# Altium schematic sheet HMS.Power.SchDoc
size A4
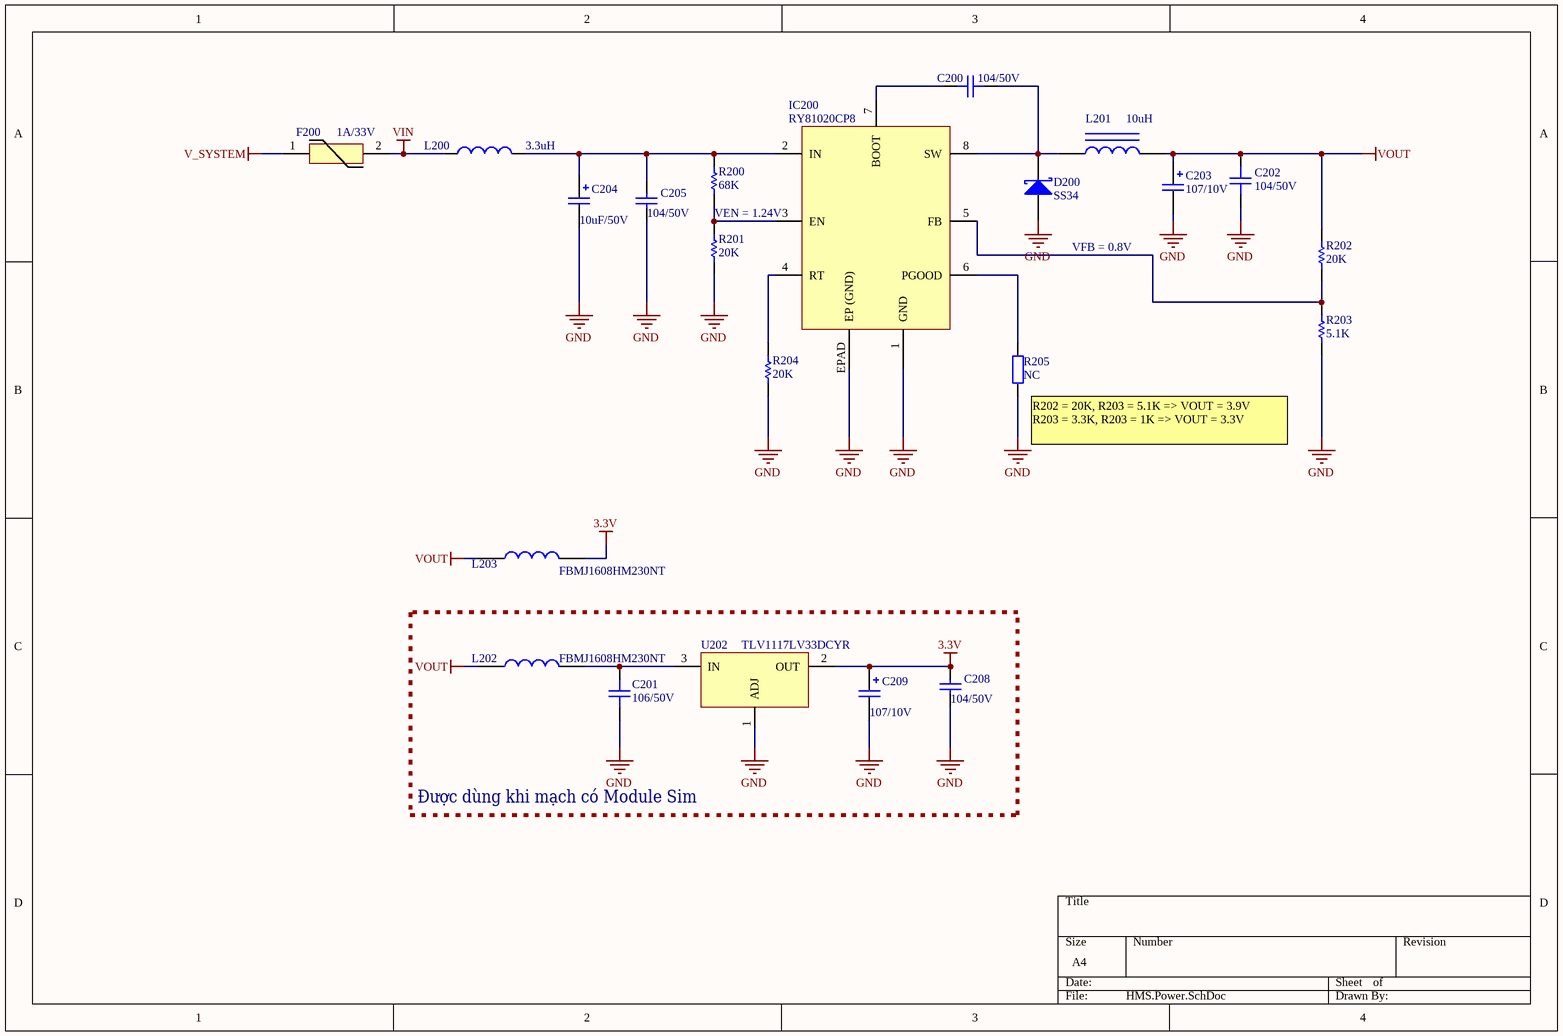
[diagram p0: HMS.Power.SchDoc]

## Parts
C200  104/50V  [CAP_CERAMIC_0402(1005)]
C201  106/50V  [CAP_CERAMIC_1206(3216-18)]
C202  104/50V  [CAP_CERAMIC_0402(1005)]
C203  107/10V  [CAP_TANTAL_2312(6032-28)]
C204  10uF/50V  [CAP_ALUM_SMD_5054_TYPE_C]
C205  104/50V  [CAP_CERAMIC_0402(1005)]
C208  104/50V  [CAP_CERAMIC_0402(1005)]
C209  107/10V  [CAP_TANTAL_2312(6032-28)]
D200  SS34  [DO214AC_SMA_1808]
F200  1A/33V  [MF-MSMF]
IC200  RY81020CP8  [MK9019]
L200  3.3uH  [L2.1A_3.5_3.3]
L201  10uH  [L3A_7x7x3mm]
L202  FBMJ1608HM230NT  [Inductor_0603]
L203  FBMJ1608HM230NT  [Inductor_0603]
R200  68K  [RES_0402(1005)]
R201  20K  [RES_0402(1005)]
R202  20K  [RES_0402(1005)]
R203  5.1K  [RES_0402(1005)]
R204  20K  [RES_0402(1005)]
R205  NC  [RES_0402(1005)]
U202  TLV1117LV33DCYR  [LM1117-SOP]

## Blocks framed on the sheet
Được dùng khi mạch có Module Sim: C201 C208 C209 L202 U202

## Nets
3.3V: C208.2 C209.1 L203.2 U202.2(OUT)
GND: C201.1 C202.1 C203.2 C204.2 C205.1 C208.1 C209.2 D200.1(A) IC200.1(GND) IC200.EPAD(EP_(GND)) R201.1 R203.1 R204.1 R205.1 U202.1(ADJ)
V_SYSTEM: F200.1
VIN: F200.2 L200.1
VOUT: C202.2 C203.1 L201.2 L202.1 L203.1 R202.2
NetC200_1: C200.1 D200.2(K) IC200.8(SW) L201.1
NetC200_2: C200.2 IC200.7(BOOT)
NetC201_2: C201.2 L202.2 U202.3(IN)
NetC204_1: C204.1 C205.2 IC200.2(IN) L200.2 R200.2
NetIC200_3: IC200.3(EN) R200.1 R201.2
NetIC200_4: IC200.4(RT) R204.2
NetIC200_5: IC200.5(FB) R202.1 R203.2
NetIC200_6: IC200.6(PGOOD) R205.2

## Notes on the sheet
- VEN = 1.24V
- VFB = 0.8V
- (near R205) R202 = 20K, R203 = 5.1K => VOUT = 3.9V
  R203 = 3.3K, R203 = 1K => VOUT = 3.3V

## Library data of the parts
C200 C202 = Cap Cer 0603 (1608): CAP CER 0.1UF 50V X5R 0402; MPN: CC0402KRX5R9BB104; MFR: YAGEO; Published: 8-Jun-2000; LatestRevisionDate: 17-Jul-2002; LatestRevisionNote: Re-released for DXP Platform.; PackageReference: RAD-0.3; Publisher: Altium Limited; Value: 104/50V; Category: Ceramic Capacitors
C201 = CL31A106KOHNNNE: CAP Ceramic 106/50V 10% 1206; MPN: CL31A106KBHNNNE; MFR: YAGEO; Value: 106/50V
C203 = Cap Tantal 2312 (6032-28): Capacitor Tantalum 100uF/10V 2312(6032-28); MPN: TPSC107K010R0100; Value: 107/10V
C204 = UWT1C221MCL1GS: Capacitor Alum 10uF/50V SMD 5x5.4mm; Manufacturer: Nichicon; MPN: AVS106M50C12T-F; Capacitance: 220µF; Voltage Rating: 16V; Tolerance: ±20%; Lifetime @ Temp.: 1000 Hrs @ 105°C; Ripple Current: 105mA; Surface Mount Land Size: 0.260" L x 0.260" W (6.60mm x 6.60mm); Supplier 1: Digi-Key; Manufacturer Part Number: UWT1C221MCL1GS; RoHS: RoHS Compliant; Category: Capacitors; Stock 1: 45106; Pricing 1: 1=0.46, 10=0.366, 100=0.2205, 250=0.16536 (USD); Operating Temperature: -55°C ~ 105°C; Features: General Purpose; ESR (Equivalent Series Resistance): -; Impedance: -; Mounting Type: Surface Mount; Package / Case: Radial, Can - SMD; Size / Dimension: 0.248" Dia (6.30mm); Height - Seated (Max): 0.303" (7.70mm); Lead Spacing: -; Packaging: Cut Tape (CT); ComponentLink1URL: http://www.nichicon.co.jp/english/products/pdfs/e-wt.pdf; ComponentLink1Description: http://www.nichicon.co.jp/english/products/pdfs/e-wt.pdf; Supplier Part Number 1: 493-2179-1-ND; Value: 10uF/50V
C205 C208 = Cap: CAP CER 0.1UF 50V X5R 0402; MPN: CC0402KRX5R9BB104; Published: 8-Jun-2000; LatestRevisionDate: 17-Jul-2002; LatestRevisionNote: Re-released for DXP Platform.; PackageReference: RAD-0.3; Publisher: Altium Limited; Value: 104/50V
C209 = UWT1C221MCL1GS: Cap Tantal 10uF/6.3V 10% 1206; Manufacturer: Nichicon; MPN: 293D106X96R3A2TE3; Capacitance: 220µF; Voltage Rating: 6.3V; Tolerance: ±20%; Lifetime @ Temp.: 1000 Hrs @ 105°C; Ripple Current: 105mA; Surface Mount Land Size: 0.260" L x 0.260" W (6.60mm x 6.60mm); Supplier 1: Digi-Key; Manufacturer Part Number: UWT1C221MCL1GS; RoHS: RoHS Compliant; Category: Capacitors; Stock 1: 45106; Pricing 1: 1=0.46, 10=0.366, 100=0.2205, 250=0.16536 (USD); Operating Temperature: -55°C ~ 105°C; Features: General Purpose; ESR (Equivalent Series Resistance): -; Impedance: -; Mounting Type: Surface Mount; Package / Case: Radial, Can - SMD; Size / Dimension: 0.248" Dia (6.30mm); Height - Seated (Max): 0.303" (7.70mm); Lead Spacing: -; Packaging: Cut Tape (CT); ComponentLink1URL: http://www.nichicon.co.jp/english/products/pdfs/e-wt.pdf; ComponentLink1Description: http://www.nichicon.co.jp/english/products/pdfs/e-wt.pdf; Supplier Part Number 1: 493-2179-1-ND; Value: 107/10V
D200 = Diode B340A: Diode Schottky 3A/40V DO-214AB; MFR: Diodes Incorporated; Published: 8-Jun-2000; LatestRevisionDate: 17-Jul-2002; LatestRevisionNote: Re-released for DXP Platform.; PackageReference: SMB; Publisher: Altium Limited; Code_JEDEC: DO-214-AA; Value: SS34; MPN: SS34; Category: Diodes - Rectifiers - Single
F200 = RKEF110: PTC RESET FUSE 33V 1A SMD 1812; MPN: KMC5S110RY33; MFR: Littelfuse Inc.; Solder: WAVE; Value: 1A/33V
IC200 = MK9019: 100V Input, Ultra-Low IQ, Synchronous Buck Converter; Value: RY81020CP8; MPN: RY81020CP8
L200 = Inductor: Inductor SMD 3.3uH CD43-3R3 3.5*3*2.1mm; MPN: XRCD43-3R3M; Published: 8-Jun-2000; Revision: July-2002: Re-released for DXP Platform.; Publisher: Altium Limited; Value: 3.3uH
L201 = Inductor Iron: Inductor 10uH 7x7x4mm; MPN: YPRH0704-100M; Published: 24-Mar-1999; LatestRevisionDate: 17-Jul-2002; LatestRevisionNote: Re-released for DXP Platform.; PackageReference: AXIAL-0.9; Publisher: Altium Limited; Value: 10uH
L202 L203 = CBC2012T470M: Inductor Ferrites 4A SMD 0603; Manufacturer: Taiyo Yuden; Inductance: 200nH; Current Rating: 150mA; Current - Saturation: 120mA; Tolerance: ±20%; Shielding: Unshielded; DC Resistance (DCR): 7.54 Ohm Max; Frequency - Self Resonant: 11MHz; Frequency - Test: 2.52MHz; Supplier 1: Digi-Key; Manufacturer Part Number: CBC2012T470M; RoHS: RoHS Compliant; Category: Inductors, Coils, Chokes; Stock 1: 108934; Pricing 1: 1=0.2, 10=0.188, 50=0.1762, 100=0.1645, 500=0.12926, 1000=0.10575 (USD); Packaging: Cut Tape (CT); Type: -; Material - Core: -; Q @ Freq: -; Operating Temperature: -40°C ~ 105°C; Package / Case: 0805 (2012 Metric); Size / Dimension: 0.079" L x 0.049" W x 0.049" H (2.00mm x 1.25mm x 1.25mm); Mounting Type: Surface Mount; ComponentLink1URL: http://www.yuden.co.jp/ut/product/category/inductor/CBC2012T470M.pdf; ComponentLink1Description: http://www.yuden.co.jp/ut/product/category/inductor/CBC2012T470M.pdf; Supplier Part Number 1: 587-1605-1-ND; Value: FBMJ1608HM230NT; MPN: FBMJ1608HM230NT
R200 = Res1: RES 68K OHM 5% 1/8W 0402; MPN: RC0402FR-0768KL; Published: 8-Jun-2000; LatestRevisionDate: 17-Jul-2002; LatestRevisionNote: Re-released for DXP Platform.; PackageReference: AXIAL-0.3; Publisher: Altium Limited; Value: 68K
R201 = Res1: RES 20K OHM 1% 1/8W 0402; MPN: RC0402FR-0720KL; Published: 8-Jun-2000; LatestRevisionDate: 17-Jul-2002; LatestRevisionNote: Re-released for DXP Platform.; PackageReference: AXIAL-0.3; Publisher: Altium Limited; Value: 20K
R202 = Res1: RES 20K OHM 5% 1/8W 0402; MPN: RC0402FR-0720KL; MFR: Stackpole Electronics Inc; Published: 8-Jun-2000; LatestRevisionDate: 17-Jul-2002; LatestRevisionNote: Re-released for DXP Platform.; PackageReference: AXIAL-0.3; Publisher: Altium Limited; Value: 20K; Category: Chip Resistor - Surface Mount
R203 = Res1: RES 5.1K OHM 5% 1/8W 0402; MPN: AC0402FR-075K1L; MFR: Stackpole Electronics Inc; Published: 8-Jun-2000; LatestRevisionDate: 17-Jul-2002; LatestRevisionNote: Re-released for DXP Platform.; PackageReference: AXIAL-0.3; Publisher: Altium Limited; Value: 5.1K; Category: Chip Resistor - Surface Mount
R204 = Res1: RES 20K OHM 1% 1/8W 0402; MPN: RC0402FR-0720KL; MFR: YAGEO; Published: 8-Jun-2000; LatestRevisionDate: 17-Jul-2002; LatestRevisionNote: Re-released for DXP Platform.; PackageReference: AXIAL-0.3; Publisher: Altium Limited; Value: 20K; Category: Chip Resistor - Surface Mount
U202 = TLV1117LV33DCYR: 800mA and 1A Low Dropout Positive Regulator 3.3V; MPN: TLV1117LV33DCYR; Value: TLV1117LV33DCYR
R205 = NC: MPN: NC; Value: NC; Category: 0402